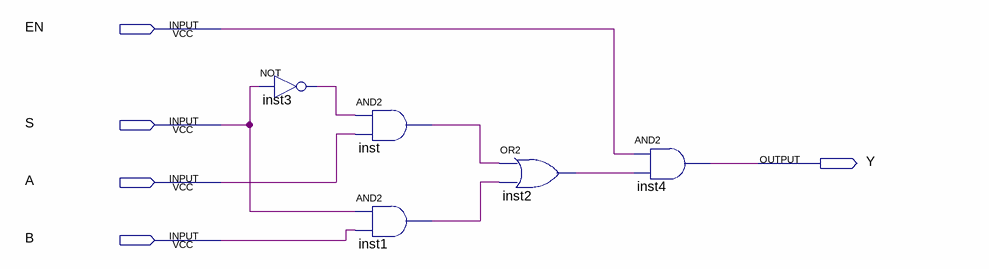
[diagram p0: schematic sheet]
// Quartus schematic MUX2_1.bdf as structural Verilog: 5 symbols, 5 pins
module MUX2_1 (
  input  EN,
  input  S,
  input  A,
  input  B,
  output Y
);

  wire inst1_out, inst2_out, inst3_out, inst_out;

  not inst3 (inst3_out, S);
  and inst (inst_out, inst3_out, A);
  and inst1 (inst1_out, S, B);
  or inst2 (inst2_out, inst_out, inst1_out);
  and inst4 (Y, EN, inst2_out);
endmodule
